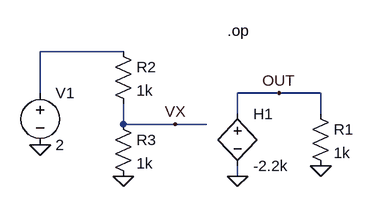
[diagram p0: schematic lt_test_hsource.asc]
lt_test_hsource.asc, the LTspice schematic file:
Version 4.1
SHEET 1 880 680
WIRE 80 32 -48 32
WIRE -48 96 -48 32
WIRE 320 96 256 96
WIRE 384 96 320 96
WIRE 256 128 256 96
WIRE 384 128 384 96
WIRE 80 144 80 112
WIRE 160 144 80 144
WIRE 208 144 160 144
WIRE 256 224 256 208
FLAG 80 224 0
FLAG 384 208 0
FLAG -48 176 0
FLAG 320 96 OUT
FLAG 160 144 VX
FLAG 256 224 0
SYMBOL res 368 112 R0
SYMATTR InstName R1
SYMATTR Value 1k
SYMBOL res 64 16 R0
SYMATTR InstName R2
SYMATTR Value 1k
SYMBOL res 64 128 R0
SYMATTR InstName R3
SYMATTR Value 1k
SYMBOL voltage -48 80 R0
WINDOW 123 0 0 Left 0
WINDOW 39 0 0 Left 0
SYMATTR InstName V1
SYMATTR Value 2
SYMBOL h 256 112 R0
SYMATTR InstName H1
SYMATTR Value -2.2k
SYMATTR SpiceModel V1
TEXT 240 0 Left 2 !.op

The netlist it stands for:
* lt_test_hsource.asc
R1 OUT 0 1k
R2 N001 VX 1k
R3 VX 0 1k
V1 N001 0 2
H1 OUT 0 V1 -2.2k
.op
.backanno
.end